# Altium project Main_Board.PrjPcb (part 40 of 44)

## Sheet USB3.SchDoc
size A3; Organization: Altium Limited; Address1: L3, 12a Rodborough Rd; Address2: Frenchs Forest; Address3: NSW; Address4: Australia 2086
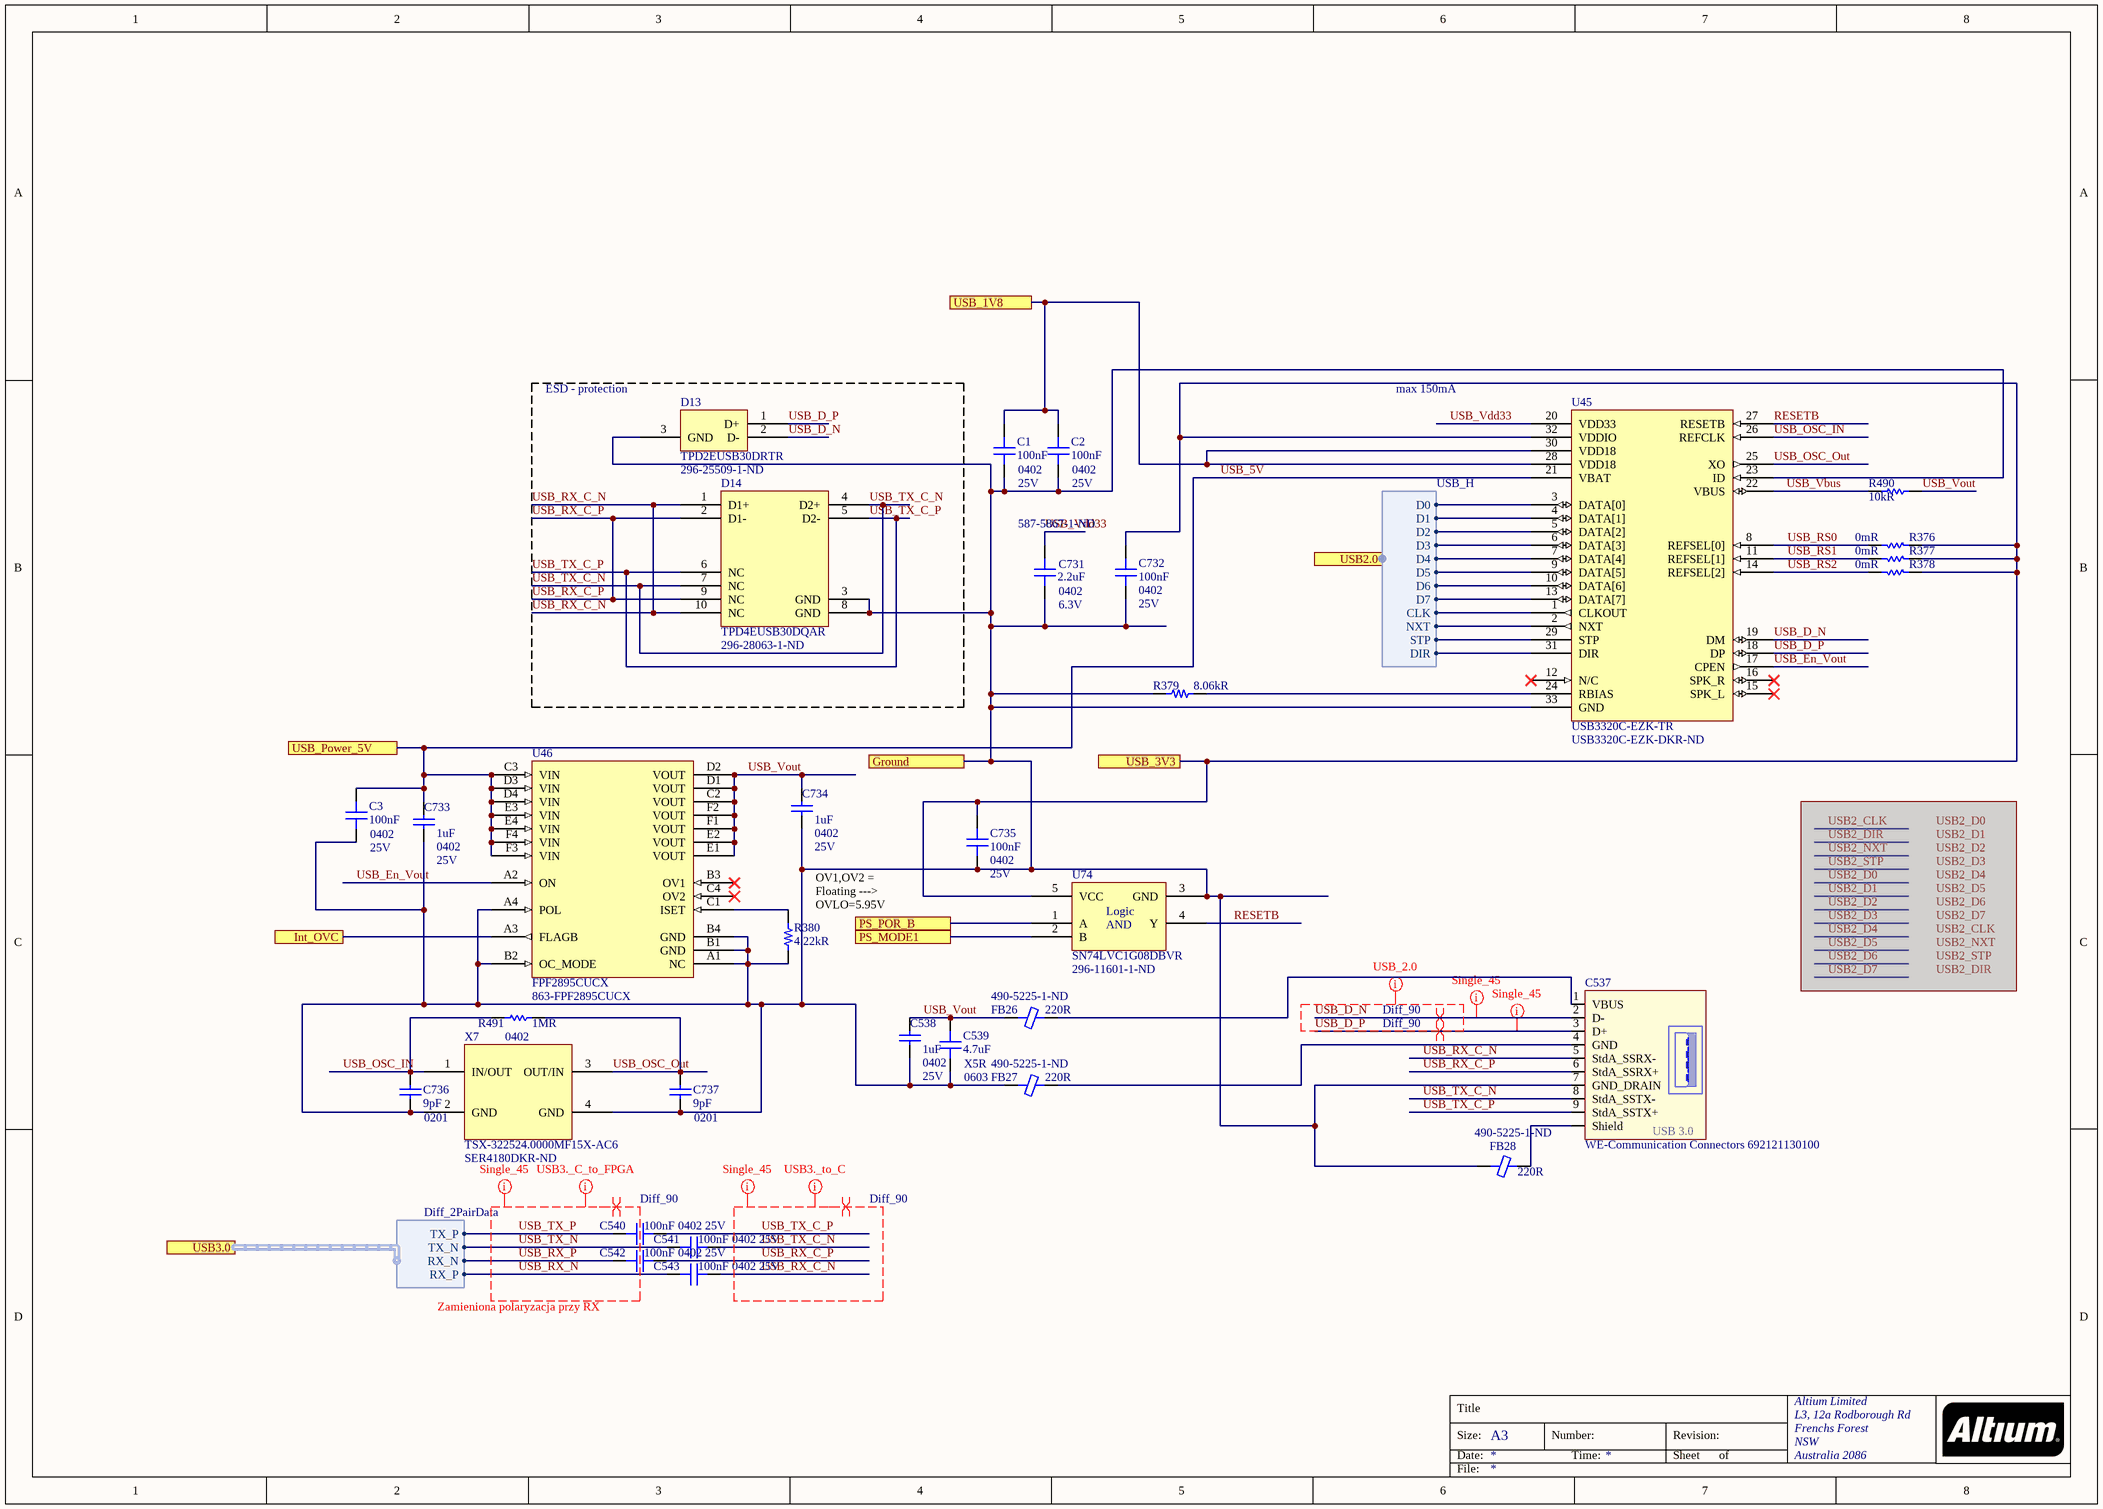
[diagram p64: USB3.SchDoc]

### Parts
C1  100nF  Case/Package: 0402  Voltage Rating: 25V  [CAP 0402/1005 KK]
C2  100nF  Case/Package: 0402  Voltage Rating: 25V  [CAP 0402/1005 KK]
C3  100nF  Case/Package: 0402  Voltage Rating: 25V  [CAP 0402/1005 KK]
C537  WE-Communication Connectors 692121130100  [692121130100]
C538  1uF  Case/Package: 0402  Voltage Rating: 25V  [CAP 0402/1005 KK]
C539  4.7uF  Case/Package: 0603  Dielectric: X5R  [CAP 0603/1608 RF]
C540  100nF  Case/Package: 0402  Voltage Rating: 25V  [CAP 0402/1005 KK]
C541  100nF  Case/Package: 0402  Voltage Rating: 25V  [CAP 0402/1005 KK]
C542  100nF  Case/Package: 0402  Voltage Rating: 25V  [CAP 0402/1005 KK]
C543  100nF  Case/Package: 0402  Voltage Rating: 25V  [CAP 0402/1005 KK]
C731  2.2uF  Supplier Part Number 1: 587-5867-1-ND  Case Code (Imperial): 0402  Voltage Rating: 6.3V  [CAP 0402/1005 KK]
C732  100nF  Case/Package: 0402  Voltage Rating: 25V  [CAP 0402/1005 KK]
C733  1uF  Case/Package: 0402  Voltage Rating: 25V  [CAP 0402/1005 KK]
C734  1uF  Case/Package: 0402  Voltage Rating: 25V  [CAP 0402/1005 KK]
C735  100nF  Case/Package: 0402  Voltage Rating: 25V  [CAP 0402/1005 KK]
C736  9pF  Case/Package: 0201  [CAP 0201/0603 KK]
C737  9pF  Case/Package: 0201  [CAP 0201/0603 KK]
D13  TPD2EUSB30DRTR  Supplier Part Number 1: 296-25509-1-ND  [TPD2EUSB30]
D14  TPD4EUSB30DQAR  Supplier Part Number 1: 296-28063-1-ND  [TPD4EUSB30]
FB26  220R  Supplier Part Number 1: 490-5225-1-ND  [FER 0603/1608]
FB27  220R  Supplier Part Number 1: 490-5225-1-ND  [FER 0603/1608]
FB28  220R  Supplier Part Number 1: 490-5225-1-ND  [FER 0603/1608]
R376  0mR  [RES 0402/1005 RF KK]
R377  0mR  [RES 0402/1005 RF KK]
R378  0mR  [RES 0402/1005 RF KK]
R379  8.06kR  [RES 0402/1005 RF KK]
R380  4.22kR  [RES 0402/1005 RF KK]
R490  10kR  [RES 0402/1005 RF KK]
R491  1MR  Case/Package: 0402  [RES 0402/1005 RF KK]
U45  USB3320C-EZK-TR  Supplier Part Number 1: USB3320C-EZK-DKR-ND  [USB3320]
U46  FPF2895CUCX  Supplier Part Number 1: 863-FPF2895CUCX  [FPF2895C-D]
U74  SN74LVC1G08DBVR  Supplier Part Number 1: 296-11601-1-ND  [SN74LVC1G08DBVR]
X7  TSX-322524.0000MF15X-AC6  Supplier Part Number 1: SER4180DKR-ND  [TSX-3225 24.0000MF15X-AC6]

### Blocks framed on the sheet
ESD - protection: D13 D14

### Ports
Ground, Int_OVC, PS_MODE1, PS_POR_B, USB2.0 (harness USB_H), USB3.0 (harness Diff_2PairData), USB_1V8, USB_3V3, USB_Power_5V

### Harnesses
Diff_2PairData: RX_P, RX_N, TX_P, TX_N
USB_H: CLK, DIR, NXT, STP, D0, D1, D2, D3, D4, D5, D6, D7

### Nets
B503_Ground: C1.1 C2.1 C3.1 C537.7(GND_DRAIN) C538.2 C539.1 C731.1 C732.2 C733.2 C734.2 C735.2 C736.1 C737.1 D13.3(GND) D14.3(GND) D14.8(GND) FB27.1 FB28.1 R379.1 R380.1 U45.23(ID) U45.33(GND) U46.A1(NC) U46.A4(POL) U46.B1(GND) U46.B2(OC_MODE) U46.B4(GND) U74.3(GND) X7.2(GND) X7.4(GND) ; port Ground
1V8@1.5A: C1.2 C2.2 U45.28(VDD18) U45.30(VDD18) ; port USB_1V8
3V3_RAIL: C732.1 C735.1 R376.2 R377.2 R378.2 U45.32(VDDIO) U74.5(VCC) ; port USB_3V3
GPIOa_01.GPIO5: U46.A3(FLAGB) ; port Int_OVC
PS_MODE1: U74.2(B) ; port PS_MODE1
PS_POR: U74.1(A) ; port PS_POR_B
RESETB: U45.27(RESETB) U74.4(Y)
USB2_CLK: U45.1(CLKOUT) ; port USB2.0.CLK
USB2_D0: U45.3(DATA[0]) ; port USB2.0.D0
USB2_D1: U45.4(DATA[1]) ; port USB2.0.D1
USB2_D2: U45.5(DATA[2]) ; port USB2.0.D2
USB2_D3: U45.6(DATA[3]) ; port USB2.0.D3
USB2_D4: U45.7(DATA[4]) ; port USB2.0.D4
USB2_D5: U45.9(DATA[5]) ; port USB2.0.D5
USB2_D6: U45.10(DATA[6]) ; port USB2.0.D6
USB2_D7: U45.13(DATA[7]) ; port USB2.0.D7
USB2_DIR: U45.31(DIR) ; port USB2.0.DIR
USB2_NXT: U45.2(NXT) ; port USB2.0.NXT
USB2_STP: U45.29(STP) ; port USB2.0.STP
USB_5V: C3.2 C733.1 U45.21(VBAT) U46.C3(VIN) U46.D3(VIN) U46.D4(VIN) U46.E3(VIN) U46.E4(VIN) U46.F3(VIN) U46.F4(VIN) ; port USB_Power_5V  [project net 5V_RAIL]
USB_D_N: C537.2(D-) D13.2(D-) U45.19(DM)
USB_D_P: C537.3(D+) D13.1(D+) U45.18(DP)
USB_En_Vout: U45.17(CPEN) U46.A2(ON)
USB_OSC_IN: C736.2 R491.2 U45.26(REFCLK) X7.1(IN/OUT)
USB_OSC_Out: C737.2 R491.1 U45.25(XO) X7.3(OUT/IN)
USB_RS0: R376.1 U45.8(REFSEL[0])
USB_RS1: R377.1 U45.11(REFSEL[1])
USB_RS2: R378.1 U45.14(REFSEL[2])
USB_RX_C_N: C537.5(StdA_SSRX-) C543.1 D14.1(D1+) D14.10(NC)
USB_RX_C_P: C537.6(StdA_SSRX+) C542.1 D14.2(D1-) D14.9(NC)
USB_RX_N: C543.2 ; port USB3.0.RX_P
USB_RX_P: C542.2 ; port USB3.0.RX_N
USB_TX_C_N: C537.8(StdA_SSTX-) C541.1 D14.4(D2+) D14.7(NC)
USB_TX_C_P: C537.9(StdA_SSTX+) C540.1 D14.5(D2-) D14.6(NC)
USB_TX_N: C541.2 ; port USB3.0.TX_N
USB_TX_P: C540.2 ; port USB3.0.TX_P
USB_Vbus: R490.1 U45.22(VBUS)
USB_Vdd33: C731.2 U45.20(VDD33)
USB_Vout: C538.1 C539.2 C734.1 FB26.1 R490.2 U46.C2(VOUT) U46.D1(VOUT) U46.D2(VOUT) U46.E1(VOUT) U46.E2(VOUT) U46.F1(VOUT) U46.F2(VOUT)
NetC537_1: C537.1(VBUS) FB26.2
NetC537_4: C537.4(GND) FB27.2
NetC537_Z1: C537.Z1(Shield) FB28.2
NetR379_2: R379.2 U45.24(RBIAS)
NetR380_2: R380.2 U46.C1(ISET)

Not connected (* = marked no-connect by the designer): U45 12(N/C)* 15(SPK_L)* 16(SPK_R)*; U46 B3(OV1)* C4(OV2)*

### Layout directives
differential pair; differential pair class Diff_90: USB_D_N, USB_D_P, USB_RX_C_N, USB_RX_C_P, USB_RX_N, USB_RX_P, USB_TX_C_N, USB_TX_C_P, USB_TX_N, USB_TX_P
net class Single_45: USB_D_N, USB_D_P, USB_RX_C_N, USB_RX_C_P, USB_RX_N, USB_RX_P, USB_TX_C_N, USB_TX_C_P, USB_TX_N, USB_TX_P
net class USB_2.0: USB_D_N, USB_D_P
net class USB3._to_C: USB_RX_C_N, USB_RX_C_P, USB_TX_C_N, USB_TX_C_P
net class USB3._C_to_FPGA: USB_RX_N, USB_RX_P, USB_TX_N, USB_TX_P

### Notes on the sheet
- max 150mA
- (near R380) OV1,OV2 = Floating ---> OVLO=5.95V
- (near C542) Zamieniona polaryzacja przy RX
- Title
- Size:
- Date:
- A3
- Number:
- Time:
- Revision:
- Sheet
- of
- File:
- (in symbol SN74LVC1G08DBVR) Logic
- (in symbol WE-Communication Connectors 692121130100) USB 3.0

### Library data of the parts
C1-C3 C540-C543 C732 C735 = Capacitor: as C479 on sheet RJ45; Supplier 1: Digi-Key; Supplier Part Number 1: 490-14603-1-ND; Stock 1: 89275; Pricing 1: 1 = 0,10000, 10 = 0,03400, 100 = 0,01520, 500 = 0,01088, 1000 = 0,00855, 2500 = 0,00778, 5000 = 0,00715 (USD); RoHS: Yes; Mount: Surface Mount; Weight: 0.000212oz; Case Code (Imperial): 0402; Case Code (Metric): 1005; Min Operating Temperature: -55°C; Max Operating Temperature: 125°C; Packaging: Tape and Reel; Capacitance: 100nF; Termination: SMD/SMT; Composition: Ceramic; Voltage Rating (DC): 25V; Package Quantity: 50000; Length: 0.039inch; Height: 0.5mm; Width: 0.5mm; Thickness: 0.022inch; ComponentLink1URL: http://www.mouser.com/ds/2/281/c02e-2905.pdf?src-supplier=Mouser; ComponentLink1Description: http://www.mouser.com/ds/2/281/c02e-2905.pdf?src-supplier=Mouser; ComponentLink2URL: http://search.murata.co.jp/Ceramy/image/img/A01X/G101/ENG/GRM155R71E104KE14-01.pdf?src-supplier=Digi-Key; ComponentLink2Description: http://search.murata.co.jp/Ceramy/image/img/A01X/G101/ENG/GRM155R71E104KE14-01.pdf?src-supplier=Digi-Key
C537 = WE-Communication Connectors 692121130100: WR-COM USB 3.0 Horizontal Type A; Manufacturer: Würth Elektronik eiSos GmbH; ComponentLink1 Description: Manufacturer; ComponentLink2 Description: Datasheet; NoPins: 9; ComponentLink1URL: http://www.we-online.de; ComponentLink2URL: http://katalog.we-online.de/em/datasheet/692121130100.pdf; Created by: Karrer Zheng; Created Date: 10/10/2014; partNo: 692121130100
C538 C733 C734 = Capacitor: as C485 on sheet RJ45; Supplier 1: Digi-Key; Supplier Part Number 1: 490-12263-1-ND; Manufacturer: Murata; Manufacturer Part Number: GRT155R61E105KE01D; RoHS: Yes; Category: Ceramic Capacitors; Stock 1: 341453; Pricing 1: 1=0,18000, 10=0,12300, 100=0,06210, 500=0,04248, 1000=0,03758, 2500=0,03594, 5000=0,03268 (USD); Mount: Surface Mount; Case Code (Metric): 1005; Case Code (Imperial): 0402; Min Operating Temperature: -55°C; Max Operating Temperature: 85°C; Packaging: Tape and Reel; Capacitance: 1uF; Tolerance: 10%; Dielectric: X5R; Voltage Rating (DC): 25V; Length: 0.039inch; Width: 0.02inch; Thickness: 0.022inch; Ratings: AEC-Q200; ComponentLink1URL: http://www.farnell.com/datasheets/2165918.pdf?src-supplier=Farnell; ComponentLink1Description: http://www.farnell.com/datasheets/2165918.pdf?src-supplier=Farnell; ComponentLink2URL: http://search.murata.co.jp/Ceramy/image/img/A01X/G101/ENG/GRT155R61E105KE01-01.pdf?src-supplier=Digi-Key; ComponentLink2Description: http://search.murata.co.jp/Ceramy/image/img/A01X/G101/ENG/GRT155R61E105KE01-01.pdf?src-supplier=Digi-Key; ComponentLink3URL: http://www.farnell.com/datasheets/2165918.pdf?src-supplier=Element14; ComponentLink3Description: http://www.farnell.com/datasheets/2165918.pdf?src-supplier=Element14
C539 = Capacitor: as C560 on sheet FTDI; Supplier 1: Digi-Key; Supplier Part Number 1: 1276-1044-1-ND; Stock 1: 2124648; Pricing 1: 1 = 0,13000, 10 = 0,09600, 100 = 0,04520, 500 = 0,03168, 1000 = 0,02622 (USD); RoHS: Yes; Mount: Surface Mount; Case Code (Metric): 1608; Case Code (Imperial): 0603; Contact Plating: Tin; Min Operating Temperature: -55°C; Max Operating Temperature: 85°C; Capacitance: 4.7uF; Package Quantity: 1; Packaging: Tape and Reel; Length: 1.6mm; Height: 0.8mm; Width: 0.031inch; Thickness: 0.035inch; Depth: 0.8mm; Radiation Hardening: No; ComponentLink1URL: https://datasheet.ciiva.com/25797/cl10a475kp8nnnc-25797520.pdf?src-supplier=Digi-Key; ComponentLink1Description: https://datasheet.ciiva.com/25797/cl10a475kp8nnnc-25797520.pdf?src-supplier=Digi-Key; ComponentLink2URL: https://datasheet.ciiva.com/26838/getdatasheetpartid-358676-26838384.pdf?src-supplier=Verical; ComponentLink2Description: https://datasheet.ciiva.com/26838/getdatasheetpartid-358676-26838384.pdf?src-supplier=Verical; ComponentLink3URL: https://datasheet.ciiva.com/16318/cl05b104kq5nnnc-16318245.pdf?src-supplier=Future+Electronics; ComponentLink3Description: https://datasheet.ciiva.com/16318/cl05b104kq5nnnc-16318245.pdf?src-supplier=Future+Electronics
C731 = Capacitor: CAP CER 2.2UF 6.3V X5R 0402; Manufacturer: Taiyo Yuden; Manufacturer Part Number: JMK105BJ225KV-F; Tolerance: 10%; Supplier 1: Digi-Key; RoHS: Yes; Category: Ceramic Capacitors; Stock 1: 4812; Pricing 1: 1=0,10000, 10=0,06000, 100=0,02650, 500=0,01894, 1000=0,01488, 2500=0,01352, 5000=0,01244 (USD); Mount: Surface Mount; Case/Package: 0402; Case Code (Metric): 1005; Min Operating Temperature: -55°C; Max Operating Temperature: 85°C; Packaging: Tape and Reel; Capacitance: 2.2uF; Package Quantity: 10000; Voltage Rating (DC): 6.3V; Dielectric: X5R; Termination: SMD/SMT; Composition: Ceramic; Length: 1mm; Height: 0.5mm; Width: 0.5mm; Thickness: 0.022inch; Depth: 0.5mm; Radiation Hardening: No; ComponentLink1URL: https://datasheet.ciiva.com/15921/tmk105b7103kv-15921011.pdf?src-supplier=Onlinecomponents.com; ComponentLink1Description: https://datasheet.ciiva.com/15921/tmk105b7103kv-15921011.pdf?src-supplier=Onlinecomponents.com; ComponentLink2URL: https://datasheet.ciiva.com/30178/cmultilayerceramiccapacitor-30178599.pdf?src-supplier=Onlinecomponents.com; ComponentLink2Description: https://datasheet.ciiva.com/30178/cmultilayerceramiccapacitor-30178599.pdf?src-supplier=Onlinecomponents.com
C736 C737 = Capacitor: Manufacturer: Murata; Manufacturer Part Number: GRM0335C1E9R0CA01D; Voltage Rating: 25V; Supplier 1: Digi-Key; Supplier Part Number 1: 490-16718-1-ND; Stock 1: 29550; Pricing 1: 1 = 0,10000, 10 = 0,01700, 100 = 0,00740, 500 = 0,00532, 1000 = 0,00417, 2500 = 0,00380, 5000 = 0,00349 (USD); RoHS: Yes; Mount: Surface Mount; Case Code (Metric): 0603; Case Code (Imperial): 0201; Min Operating Temperature: -55°C; Max Operating Temperature: 125°C; Capacitance: 9pF; Packaging: Tape and Reel; Package Quantity: 15000; Termination: SMD/SMT; Voltage Rating (DC): 25V; Length: 0.024inch; Width: 0.012inch; Thickness: 0.013inch; ComponentLink1URL: https://datasheet.ciiva.com/29538/grm0335c1e9r0ca01-01-29538834.pdf?src-supplier=Digi-Key; ComponentLink1Description: https://datasheet.ciiva.com/29538/grm0335c1e9r0ca01-01-29538834.pdf?src-supplier=Digi-Key
D13 = TPD2EUSB30DRTR: as D15 on sheet FTDI; Supplier 1: Digi-Key; Manufacturer Part Number: TPD2EUSB30DRTR; RoHS: Yes; Category: Interface ICs; Stock 1: 293674; Pricing 1: 1=0,58000, 10=0,49400, 25=0,46160, 100=0,34280, 250=0,32564, 500=0,26764, 1000=0,21754 (USD); Case/Package: SOT; Number of Pins: 3; Min Operating Temperature: -40°C; Max Operating Temperature: 85°C; Packaging: Tape and Reel; Package Quantity: 1; Reverse Standoff Voltage: 5.5V; Clamping Voltage: 8V; Breakdown Voltage: 9V; Number of Channels: 2; Working Voltage: 5.5V; ESD Protection: Yes; Length: 1mm; Height: 0.45mm; Depth: 0.8mm; Width: 0.85mm; Radiation Hardening: No; REACH SVHC: No SVHC; Lead Free: Lead Free; ComponentLink1URL: https://datasheet.ciiva.com/1611/tpd2eusb30-1611602.pdf?src-supplier=Newark; ComponentLink1Description: https://datasheet.ciiva.com/1611/tpd2eusb30-1611602.pdf?src-supplier=Newark; ComponentLink2URL: https://datasheet.ciiva.com/15134/getdatasheetpartid-202713-15134479.pdf?src-supplier=Verical; ComponentLink2Description: https://datasheet.ciiva.com/15134/getdatasheetpartid-202713-15134479.pdf?src-supplier=Verical; ComponentLink3URL: https://datasheet.ciiva.com/26787/tpd2eusb30drtr-26787652.pdf?src-supplier=IIIC; ComponentLink3Description: https://datasheet.ciiva.com/26787/tpd2eusb30drtr-26787652.pdf?src-supplier=IIIC; ComponentLink4URL: https://datasheet.ciiva.com/353/tpd2eusb30-353272.pdf?src-supplier=Digi-Key; ComponentLink4Description: https://datasheet.ciiva.com/353/tpd2eusb30-353272.pdf?src-supplier=Digi-Key; ComponentLink5URL: https://datasheet.ciiva.com/1504/1882087-1504248.pdf?src-supplier=Element14; ComponentLink5Description: https://datasheet.ciiva.com/1504/1882087-1504248.pdf?src-supplier=Element14; ComponentLink6URL: https://datasheet.ciiva.com/353/tpd2eusb30-353273.pdf?src-supplier=Digi-Key; ComponentLink6Description: https://datasheet.ciiva.com/353/tpd2eusb30-353273.pdf?src-supplier=Digi-Key; ComponentLink7URL: https://datasheet.ciiva.com/25956/tpd4eusb30-25956841.pdf?src-supplier=Avnet+Europe; ComponentLink7Description: https://datasheet.ciiva.com/25956/tpd4eusb30-25956841.pdf?src-supplier=Avnet+Europe; ComponentLink8URL: https://datasheet.ciiva.com/353/tpd2eusb30-353274.pdf?src-supplier=Digi-Key; ComponentLink8Description: https://datasheet.ciiva.com/353/tpd2eusb30-353274.pdf?src-supplier=Digi-Key
D14 = TPD4EUSB30DQAR: TVS DIODE 5.5V 8V 10SON; Manufacturer: Texas Instruments; Direction: Unidirectional; Capacitance: 0.8pF; Current Rating: 5A; Number of Bidirectional Channels: 4; Peak Pulse Power: 45W; Power Line Protection: Yes; Breakdown Voltage: 7V; Data Rate: 6Gbps; Peak Pulse Current: 1A; Interface: USB; Supplier 1: Digi-Key; Manufacturer Part Number: TPD4EUSB30DQAR; RoHS: Yes; Category: TVS Diodes; Stock 1: 69157; Pricing 1: 1=0,81000, 10=0,71400, 25=0,67040, 100=0,48670, 250=0,46936, 500=0,40664, 1000=0,34608 (USD); Number of Pins: 10; Min Operating Temperature: -40°C; Max Operating Temperature: 85°C; Package Quantity: 1; Packaging: Tape and Reel; Reverse Standoff Voltage: 5.5V; Min Breakdown Voltage: 8V; Clamping Voltage: 8V; Number of Channels: 4; Termination: SMD/SMT; Working Voltage: 5.5V; ESD Protection: Yes; Length: 2.5mm; Height: 0.5mm; Width: 1.1mm; Depth: 1mm; Radiation Hardening: No; REACH SVHC: No SVHC; Lead Free: Lead Free; ComponentLink1URL: https://datasheet.ciiva.com/339/tpd4eusb30-339202.pdf?src-supplier=Digi-Key; ComponentLink1Description: https://datasheet.ciiva.com/339/tpd4eusb30-339202.pdf?src-supplier=Digi-Key; ComponentLink2URL: https://datasheet.ciiva.com/41659/1634000-41659268.pdf?src-supplier=Farnell; ComponentLink2Description: https://datasheet.ciiva.com/41659/1634000-41659268.pdf?src-supplier=Farnell; ComponentLink3URL: https://datasheet.ciiva.com/15134/getdatasheetpartid-299321-15134669.pdf?src-supplier=Verical; ComponentLink3Description: https://datasheet.ciiva.com/15134/getdatasheetpartid-299321-15134669.pdf?src-supplier=Verical; ComponentLink4URL: https://datasheet.ciiva.com/339/tpd4eusb30-339204.pdf?src-supplier=Digi-Key; ComponentLink4Description: https://datasheet.ciiva.com/339/tpd4eusb30-339204.pdf?src-supplier=Digi-Key; ComponentLink5URL: https://datasheet.ciiva.com/1504/1882087-1504249.pdf?src-supplier=Element14; ComponentLink5Description: https://datasheet.ciiva.com/1504/1882087-1504249.pdf?src-supplier=Element14; ComponentLink6URL: https://datasheet.ciiva.com/339/tpd4eusb30-339203.pdf?src-supplier=Digi-Key; ComponentLink6Description: https://datasheet.ciiva.com/339/tpd4eusb30-339203.pdf?src-supplier=Digi-Key; ComponentLink7URL: https://datasheet.ciiva.com/22621/1882087-22621482.pdf?src-supplier=Element14; ComponentLink7Description: https://datasheet.ciiva.com/22621/1882087-22621482.pdf?src-supplier=Element14
FB26-FB28 = Ferrite: as FB29 on sheet uSD; Supplier 1: Digi-Key; RoHS: Yes; Category: Inductors; Stock 1: 123623; Pricing 1: 1=0,14000, 10=0,11600, 25=0,09040, 50=0,07500, 100=0,06460, 250=0,05172, 500=0,04654, 1000=0,03878, 5000=0,03619 (USD); Case/Package: 0603; Number of Pins: 2; Weight: 7.1E-05oz; Core Material: Ferrite; Case Code (Metric): 1608; Case Code (Imperial): 0603; Min Operating Temperature: -55°C; Max Operating Temperature: 125°C; Package Quantity: 1; Impedance: 220R; Packaging: Tape and Reel; Current Rating: 2.5A; Termination: SMD/SMT; Max DC Current: 2.5A; DC Current: 2.5A; Number of Circuits: 1; Length: 1.6mm; Height: 0.8mm; Width: 0.8mm; Depth: 0.95mm; Radiation Hardening: No; REACH SVHC: No SVHC; Lead Free: Lead Free; ComponentLink1URL: https://datasheet.ciiva.com/1561/c31e-1561456.pdf?src-supplier=Newark; ComponentLink1Description: https://datasheet.ciiva.com/1561/c31e-1561456.pdf?src-supplier=Newark; ComponentLink2URL: https://datasheet.ciiva.com/41449/001171724-da-01-en-chip-drossel0603-220r-2500ma-1-6x0-8mm-41449352.pdf?src-supplier=Conrad; ComponentLink2Description: https://datasheet.ciiva.com/41449/001171724-da-01-en-chip-drossel0603-220r-2500ma-1-6x0-8mm-41449352.pdf?src-supplier=Conrad; ComponentLink3URL: https://datasheet.ciiva.com/41449/001172313-da-01-en-drossel-0603-220r-21-6x0-8mm-10000st-41449677.pdf?src-supplier=Conrad; ComponentLink3Description: https://datasheet.ciiva.com/41449/001172313-da-01-en-drossel-0603-220r-21-6x0-8mm-10000st-41449677.pdf?src-supplier=Conrad; ComponentLink4URL: https://datasheet.ciiva.com/1012/l0110s0100blm18s-1012626.pdf?src-supplier=Digi-Key; ComponentLink4Description: https://datasheet.ciiva.com/1012/l0110s0100blm18s-1012626.pdf?src-supplier=Digi-Key; ComponentLink5URL: https://datasheet.ciiva.com/1012/l0110s0100blm18s-1012627.pdf?src-supplier=Digi-Key; ComponentLink5Description: https://datasheet.ciiva.com/1012/l0110s0100blm18s-1012627.pdf?src-supplier=Digi-Key; ComponentLink6URL: https://datasheet.ciiva.com/1012/l0110s0100blm18s-1012628.pdf?src-supplier=Digi-Key; ComponentLink6Description: https://datasheet.ciiva.com/1012/l0110s0100blm18s-1012628.pdf?src-supplier=Digi-Key; ComponentLink7URL: https://datasheet.ciiva.com/17279/l0110s0100blm18s-17279573.pdf?src-supplier=Avnet+Europe; ComponentLink7Description: https://datasheet.ciiva.com/17279/l0110s0100blm18s-17279573.pdf?src-supplier=Avnet+Europe; ComponentLink8URL: https://datasheet.ciiva.com/8508/l0110s0100blm18s-8508310.pdf?src-supplier=Avnet; ComponentLink8Description: https://datasheet.ciiva.com/8508/l0110s0100blm18s-8508310.pdf?src-supplier=Avnet; ComponentLink9URL: https://datasheet.ciiva.com/8021/5151-8021517.pdf?src-supplier=Element14; ComponentLink9Description: https://datasheet.ciiva.com/8021/5151-8021517.pdf?src-supplier=Element14; ComponentLink10URL: https://datasheet.ciiva.com/16204/l0110s0100blm18s-16204029.pdf?src-supplier=Future+Electronics; ComponentLink10Description: https://datasheet.ciiva.com/16204/l0110s0100blm18s-16204029.pdf?src-supplier=Future+Electronics; ComponentLink11URL: https://datasheet.ciiva.com/14122/blm-series-eng-tds-14122910.pdf?src-supplier=Distrelec; ComponentLink11Description: https://datasheet.ciiva.com/14122/blm-series-eng-tds-14122910.pdf?src-supplier=Distrelec; ComponentLink12URL: https://datasheet.ciiva.com/8021/5151-8021519.pdf?src-supplier=Element14; ComponentLink12Description: https://datasheet.ciiva.com/8021/5151-8021519.pdf?src-supplier=Element14
R376-R378 = Resistor: as R711-R713 on sheet RJ45; Supplier 1: Digi-Key; Supplier Part Number 1: 311-0.0JRCT-ND; Stock 1: 69822252; Pricing 1: 1=0.10000, 10=0.01200, 25=0.00920, 50=0.00680, 100=0.00510, 250=0.00388, 500=0.00308, 1000=0.00227, 5000=0.00163 (USD); RoHS: Yes; Case/Package: 0402; Contact Plating: Tin,Matte; Case Code (Metric): 1005; Case Code (Imperial): 0402; Min Operating Temperature: -55°C; Max Operating Temperature: 155°C; Resistance: 0mR; Packaging: Tape and Reel; Composition: Thick Film; Package Quantity: 1; Number of Terminations: 2; Termination: SMD/SMT; Military Standard: Not; Features: Moisture Resistant; Length: 1mm; Height: 0.016inch; Width: 0.02inch; Depth: 0.5mm; Radiation Hardening: No; REACH SVHC: Unknown; Lead Free: Lead Free; ComponentLink1URL: https://datasheet.ciiva.com/2452/pyu-rc0402-51-rohs-l-6-2452608.pdf?src-supplier=Digi-Key; ComponentLink1Description: https://datasheet.ciiva.com/2452/pyu-rc0402-51-rohs-l-6-2452608.pdf?src-supplier=Digi-Key; ComponentLink2URL: https://datasheet.ciiva.com/11808/0900766b80c66297-11808195.pdf?src-supplier=RSComponents; ComponentLink2Description: https://datasheet.ciiva.com/11808/0900766b80c66297-11808195.pdf?src-supplier=RSComponents; ComponentLink3URL: https://datasheet.ciiva.com/2452/pyu-r-int-thick-7-2452609.pdf?src-supplier=Digi-Key; ComponentLink3Description: https://datasheet.ciiva.com/2452/pyu-r-int-thick-7-2452609.pdf?src-supplier=Digi-Key; ComponentLink4URL: https://datasheet.ciiva.com/22747/1018594-22747515.pdf?src-supplier=Element14; ComponentLink4Description: https://datasheet.ciiva.com/22747/1018594-22747515.pdf?src-supplier=Element14; ComponentLink5URL: https://datasheet.ciiva.com/7983/1018594-7983535.pdf?src-supplier=Element14; ComponentLink5Description: https://datasheet.ciiva.com/7983/1018594-7983535.pdf?src-supplier=Element14; ComponentLink6URL: https://datasheet.ciiva.com/2452/pyu-r-int-thick-7-2452610.pdf?src-supplier=Digi-Key; ComponentLink6Description: https://datasheet.ciiva.com/2452/pyu-r-int-thick-7-2452610.pdf?src-supplier=Digi-Key; ComponentLink7URL: https://datasheet.ciiva.com/8896/pyu-rc0402-51-rohs-l-6-8896201.pdf?src-supplier=Avnet; ComponentLink7Description: https://datasheet.ciiva.com/8896/pyu-rc0402-51-rohs-l-6-8896201.pdf?src-supplier=Avnet; ComponentLink8URL: https://datasheet.ciiva.com/28386/pyu-rc0402-51-rohs-l-6-28386633.pdf?src-supplier=Avnet+Europe; ComponentLink8Description: https://datasheet.ciiva.com/28386/pyu-rc0402-51-rohs-l-6-28386633.pdf?src-supplier=Avnet+Europe; ComponentLink9URL: https://datasheet.ciiva.com/15189/getdatasheetpartid-326379-15189533.pdf?src-supplier=Verical; ComponentLink9Description: https://datasheet.ciiva.com/15189/getdatasheetpartid-326379-15189533.pdf?src-supplier=Verical
R379 = Resistor: RES 8.06K OHM 1% 1/16W 0402; Manufacturer: Stackpole Electronics; Manufacturer Part Number: RMCF0402FT8K06; Max Power Dissipation: 63mW; Temperature Coefficient: 100ppm/°C; Supplier 1: Digi-Key; Supplier Part Number 1: RMCF0402FT8K06CT-ND; RoHS: Yes; Category: Chip SMD Resistors; Stock 1: 98746; Pricing 1: 1=0,10000, 10=0,01400, 100=0,00580, 1000=0,00262, 2500=0,00228, 5000=0,00188 (USD); Mount: Surface Mount; Case/Package: 0402; Case Code (Metric): 1005; Case Code (Imperial): 0402; Contact Plating: Tin,Matte; Min Operating Temperature: -55°C; Max Operating Temperature: 155°C; Packaging: Tape and Reel; Resistance: 8.06kR; Tolerance: 1%; Composition: Thick Film; Number of Terminations: 2; Features: Automotive AEC-Q200; Length: 0.039inch; Height: 0.016inch; Width: 0.02inch; Radiation Hardening: No; Lead Free: Lead Free; ComponentLink1URL: https://www.seielect.com/catalog/SEI-RMCF_RMCP.pdf?src-supplier=Avnet; ComponentLink1Description: https://www.seielect.com/catalog/SEI-RMCF_RMCP.pdf?src-supplier=Avnet; ComponentLink2URL: https://www.seielect.com/catalog/SEI-Packaging.pdf?src-supplier=Digi-Key; ComponentLink2Description: https://www.seielect.com/catalog/SEI-Packaging.pdf?src-supplier=Digi-Key; ComponentLink3URL: https://www.seielect.com/Catalog/SEI-RMCF_RMCP.pdf?src-supplier=Digi-Key; ComponentLink3Description: https://www.seielect.com/Catalog/SEI-RMCF_RMCP.pdf?src-supplier=Digi-Key
R380 = Resistor: Thick Film Resistors 4.22K OHM 1%; Manufacturer: Yageo; Manufacturer Part Number: RC0402FR-074K22L; Temperature Coefficient: 100ppm/°C; Power Rating: 62.5mW; Voltage Rating: 50V; Max Power Dissipation: 63mW; Supplier 1: Digi-Key; Supplier Part Number 1: YAG3172CT-ND; RoHS: Yes; Category: Chip SMD Resistors; Stock 1: 1001822; Pricing 1: 1=0,10000, 10=0,01600, 100=0,00640, 1000=0,00289, 2500=0,00251, 5000=0,00207 (USD); Case/Package: 0402; Contact Plating: Tin,Matte; Case Code (Imperial): 0402; Case Code (Metric): 1005; Min Operating Temperature: -55°C; Max Operating Temperature: 155°C; Tolerance: 1%; Resistance: 4.22kR; Composition: Thick Film; Packaging: Tape and Reel; Number of Terminations: 2; Termination: SMD/SMT; Military Standard: Not; Voltage Rating (DC): 50V; Features: Moisture Resistant; Length: 1mm; Height: 0.016inch; Width: 0.02inch; Depth: 0.5mm; Lead Free: Lead Free; ComponentLink1URL: https://datasheet.ciiva.com/26830/getdatasheetpartid-329268-26830134.pdf?src-supplier=Verical; ComponentLink1Description: https://datasheet.ciiva.com/26830/getdatasheetpartid-329268-26830134.pdf?src-supplier=Verical; ComponentLink2URL: https://datasheet.ciiva.com/8893/pyu-rc0402-51-rohs-l-6-8893193.pdf?src-supplier=Avnet; ComponentLink2Description: https://datasheet.ciiva.com/8893/pyu-rc0402-51-rohs-l-6-8893193.pdf?src-supplier=Avnet; ComponentLink3URL: https://datasheet.ciiva.com/28410/pyu-rc0402-51-rohs-l-6-28410877.pdf?src-supplier=Avnet+Europe; ComponentLink3Description: https://datasheet.ciiva.com/28410/pyu-rc0402-51-rohs-l-6-28410877.pdf?src-supplier=Avnet+Europe; ComponentLink4URL: https://datasheet.ciiva.com/5558/pyu-rc0402-51-rohs-l-6-r-5558170.pdf?src-supplier=Mouser; ComponentLink4Description: https://datasheet.ciiva.com/5558/pyu-rc0402-51-rohs-l-6-r-5558170.pdf?src-supplier=Mouser; ComponentLink5URL: https://datasheet.ciiva.com/16857/pyu-rc0402-51-rohs-l-6-16857340.pdf?src-supplier=Avnet+Europe; ComponentLink5Description: https://datasheet.ciiva.com/16857/pyu-rc0402-51-rohs-l-6-16857340.pdf?src-supplier=Avnet+Europe
R490 = Resistor: as R319 on sheet RJ45; Supplier 1: Digi-Key; Supplier Part Number 1: 311-10.0KLRCT-ND; Stock 1: 71214322; Pricing 1: 1=0,10000, 10=0,01500, 100=0,00600, 1000=0,00270, 2500=0,00235, 5000=0,00194 (USD); RoHS: Yes; Case/Package: 0402; Number of Pins: 2; Case Code (Imperial): 0402; Case Code (Metric): 1005; Min Operating Temperature: -55°C; Max Operating Temperature: 155°C; Resistance: 10kR; Packaging: Tape and Reel; Composition: Thick Film; Voltage Rating (DC): 50V; Termination: SMD/SMT; Military Standard: Not; Working Voltage: 50V; Number of Terminations: 2; Length: 1mm; Height: 0.32mm; Width: 0.5mm; Depth: 0.5mm; Lead Pitch: 0.2mm; REACH SVHC: No SVHC; Lead Free: Lead Free; ComponentLink1URL: https://datasheet.ciiva.com/7660/38568-7660787.pdf?src-supplier=Element14; ComponentLink1Description: https://datasheet.ciiva.com/7660/38568-7660787.pdf?src-supplier=Element14; ComponentLink2URL: https://datasheet.ciiva.com/7849/1784430-7849813.pdf?src-supplier=Element14; ComponentLink2Description: https://datasheet.ciiva.com/7849/1784430-7849813.pdf?src-supplier=Element14; ComponentLink3URL: https://datasheet.ciiva.com/7849/1686128-7849814.pdf?src-supplier=Element14; ComponentLink3Description: https://datasheet.ciiva.com/7849/1686128-7849814.pdf?src-supplier=Element14; ComponentLink4URL: https://datasheet.ciiva.com/7849/1784430-7849815.pdf?src-supplier=Element14; ComponentLink4Description: https://datasheet.ciiva.com/7849/1784430-7849815.pdf?src-supplier=Element14; ComponentLink5URL: https://datasheet.ciiva.com/22747/1018594-22747512.pdf?src-supplier=Element14; ComponentLink5Description: https://datasheet.ciiva.com/22747/1018594-22747512.pdf?src-supplier=Element14; ComponentLink6URL: https://datasheet.ciiva.com/12667/pyu-rc0402-51-rohs-l-6-r-12667067.pdf?src-supplier=Mouser; ComponentLink6Description: https://datasheet.ciiva.com/12667/pyu-rc0402-51-rohs-l-6-r-12667067.pdf?src-supplier=Mouser; ComponentLink7URL: https://datasheet.ciiva.com/7983/1018594-7983486.pdf?src-supplier=Element14; ComponentLink7Description: https://datasheet.ciiva.com/7983/1018594-7983486.pdf?src-supplier=Element14
R491 = Resistor: as R335 on sheet RJ45; Supplier 1: Digi-Key; Supplier Part Number 1: 311-1.00MLRDKR-ND; RoHS: Yes; Category: Chip SMD Resistors; Stock 1: 10014745; Pricing 1: 1=0,10000, 10=0,01600, 100=0,00640, 1000=0,00289, 2500=0,00251, 5000=0,00207 (USD); Case Code (Imperial): 0402; Case Code (Metric): 1005; Min Operating Temperature: -55°C; Max Operating Temperature: 155°C; Packaging: Tape and Reel; Resistance: 1MR; Tolerance: 1%; Termination: SMD/SMT; Composition: Thick Film; Military Standard: Not; Length: 1mm; Height: 0.32mm; Depth: 0.5mm; REACH SVHC: Unknown; Lead Free: Lead Free; ComponentLink1URL: https://datasheet.ciiva.com/11808/0900766b80c66297-11808125.pdf?src-supplier=RSComponents; ComponentLink1Description: https://datasheet.ciiva.com/11808/0900766b80c66297-11808125.pdf?src-supplier=RSComponents; ComponentLink2URL: https://datasheet.ciiva.com/7849/1018594-7849883.pdf?src-supplier=Element14; ComponentLink2Description: https://datasheet.ciiva.com/7849/1018594-7849883.pdf?src-supplier=Element14; ComponentLink3URL: https://datasheet.ciiva.com/46394/1018594-46394951.pdf?src-supplier=Element14; ComponentLink3Description: https://datasheet.ciiva.com/46394/1018594-46394951.pdf?src-supplier=Element14; ComponentLink4URL: https://datasheet.ciiva.com/16741/pyu-rc0402-51-rohs-l-6-r-16741081.pdf?src-supplier=Future+Electronics; ComponentLink4Description: https://datasheet.ciiva.com/16741/pyu-rc0402-51-rohs-l-6-r-16741081.pdf?src-supplier=Future+Electronics; ComponentLink5URL: https://datasheet.ciiva.com/7849/1018594-7849882.pdf?src-supplier=Element14; ComponentLink5Description: https://datasheet.ciiva.com/7849/1018594-7849882.pdf?src-supplier=Element14
U45 = USB3320C-EZK-TR: IC TXRX USB 2.0 FLEXPWR 32QFN; Manufacturer 1: Microchip; Data Rate: 12Mbps; Interface: UART; Operating Supply Current: 18uA; ESD Protection: Yes; Number of Transceivers: 1; Operating Supply Voltage: 5.5V; Frequency: 60MHz; Simplex/Duplex: Half Duplex; Receiver Hysteresis: 50mV; Supplier 1: Digi-Key; Manufacturer Part Number 1: USB3320C-EZK-TR; Stock 1: 3750; Pricing 1: 1=1,55000, 25=1,29000 (USD); RoHS: Yes; Case/Package: QFN; Number of Pins: 32; Weight: 0.006653oz; Min Operating Temperature: -40°C; Max Operating Temperature: 85°C; Package Quantity: 4000; Packaging: Tape and Reel; Length: 5.1mm; Height: 0.95mm; Width: 5.1mm; Radiation Hardening: No; Lead Free: Lead Free; ComponentLink1URL: https://datasheet.ciiva.com/29718/3320-29718762.pdf?src-supplier=Digi-Key; ComponentLink1Description: https://datasheet.ciiva.com/29718/3320-29718762.pdf?src-supplier=Digi-Key; ComponentLink2URL: https://datasheet.ciiva.com/6635/filehandler-aspxddocname-en562261-6635128.pdf?src-supplier=Digi-Key; ComponentLink2Description: https://datasheet.ciiva.com/6635/filehandler-aspxddocname-en562261-6635128.pdf?src-supplier=Digi-Key; ComponentLink3URL: https://datasheet.ciiva.com/29718/filehandler-aspxddocname-en562261-29718763.pdf?src-supplier=Digi-Key; ComponentLink3Description: https://datasheet.ciiva.com/29718/filehandler-aspxddocname-en562261-29718763.pdf?src-supplier=Digi-Key
U46 = FPF2895CUCX: Current Limit Load Switch with OVP and TRCB, 28 V, 5 A; Manufacturer 1: ON Semiconductor; Supplier 1: Mouser; Manufacturer Part Number 1: FPF2895CUCX; Stock 1: 808; Pricing 1: 1=2,18000, 10=1,85000, 100=1,48000, 500=1,29000, 1000=1,07000, 3000=1,00000, 6000=0,96500, 9000=0,92800, 24000=0,89200 (USD); RoHS: No
U74 = SN74LVC1G08DBVR: as U76 on sheet RJ45; Supplier 1: Digi-Key; Manufacturer Part Number: SN74LVC1G08DBVR; Stock 1: 64376; Pricing 1: 1 = 0,27000, 10 = 0,22100, 25 = 0,18560, 100 = 0,11740, 250 = 0,09064, 500 = 0,07726, 1000 = 0,05253 (USD); RoHS: Yes; Mount: Surface Mount; Case/Package: SOT-23; Number of Pins: 5; Weight: 0.000557oz; Contact Plating: Gold; Min Operating Temperature: -40°C; Max Operating Temperature: 125°C; Packaging: Tape and Reel; Logic Function: AND; Max Output Current: 32mA; Package Quantity: 1; Number of Circuits: 1; Low Level Output Current: 32mA; Number of Gates: 1; Number of Input Lines: 2; Number of Output Lines: 1; Number of Elements: 1; Termination: SMD/SMT; Number of Bits: 1; Radiation Hardening: No; REACH SVHC: No SVHC; Lead Free: Lead Free; ComponentLink1URL: https://datasheet.ciiva.com/27049/756490-27049780.pdf?src-supplier=Jameco; ComponentLink1Description: https://datasheet.ciiva.com/27049/756490-27049780.pdf?src-supplier=Jameco; ComponentLink2URL: https://datasheet.ciiva.com/26048/sn74lvc1g08-26048421.pdf?src-supplier=Avnet+Europe; ComponentLink2Description: https://datasheet.ciiva.com/26048/sn74lvc1g08-26048421.pdf?src-supplier=Avnet+Europe; ComponentLink3URL: https://datasheet.ciiva.com/16503/sn74lvc1g08-16503398.pdf?src-supplier=Avnet+Asia; ComponentLink3Description: https://datasheet.ciiva.com/16503/sn74lvc1g08-16503398.pdf?src-supplier=Avnet+Asia; ComponentLink4URL: https://datasheet.ciiva.com/46439/1834190-46439158.pdf?src-supplier=Element14; ComponentLink4Description: https://datasheet.ciiva.com/46439/1834190-46439158.pdf?src-supplier=Element14; ComponentLink5URL: https://datasheet.ciiva.com/1864/sn74lvc1g08-1864152.pdf?src-supplier=Digi-Key; ComponentLink5Description: https://datasheet.ciiva.com/1864/sn74lvc1g08-1864152.pdf?src-supplier=Digi-Key; ComponentLink6URL: https://datasheet.ciiva.com/28540/1772545-28540795.pdf?src-supplier=Element14; ComponentLink6Description: https://datasheet.ciiva.com/28540/1772545-28540795.pdf?src-supplier=Element14; ComponentLink7URL: https://datasheet.ciiva.com/1864/sn74lvc1g08-1864153.pdf?src-supplier=Digi-Key; ComponentLink7Description: https://datasheet.ciiva.com/1864/sn74lvc1g08-1864153.pdf?src-supplier=Digi-Key
X7 = TSX-322524.0000MF15X-AC6: CRYSTAL 24.00 MHZ 9.0PF SMD; Manufacturer 1: Epson; Frequency: 24MHz; Load Capacitance: 9pF; ESR (Equivalent Series Resistance): 40R; Frequency Stability: 15ppm; Frequency Tolerance: 10ppm; Supplier 1: Digi-Key; Manufacturer Part Number 1: TSX-322524.0000MF15X-AC6; Stock 1: 33708; Pricing 1: 1=0,36000, 10=0,30300, 50=0,27220, 100=0,24200, 500=0,22990, 1000=0,19360 (USD); RoHS: Yes; Mount: Surface Mount; Case/Package: SMD/SMT; Min Operating Temperature: -40°C; Max Operating Temperature: 85°C; Packaging: Tape and Reel; Length: 0.126inch; Height: 0.024inch; Width: 0.098inch; Lead Free: Lead Free; ComponentLink1URL: https://www5.epsondevice.com/en/information/support/pdf/june_2018_psc_masterbook.pdf?src-supplier=Digi-Key; ComponentLink1Description: https://www5.epsondevice.com/en/information/support/pdf/june_2018_psc_masterbook.pdf?src-supplier=Digi-Key

## Sheet CAN.SchDoc
size A4
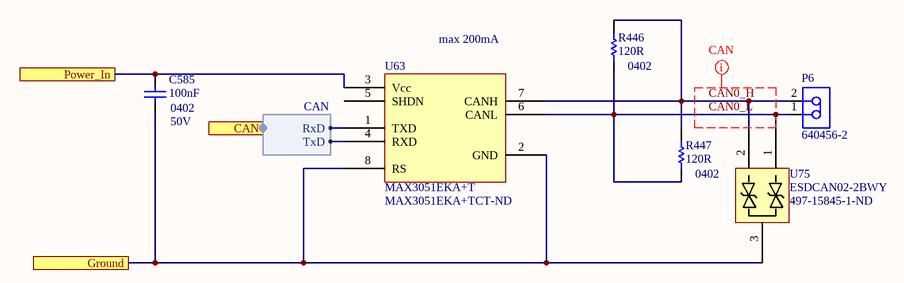
[diagram p65: CAN.SchDoc]

### Parts
C585  100nF  Case Code (Imperial): 0402  Voltage: 50V  [CAP 0402/1005 KK]
P6  640456-2  [TECO-640456-2_V]
R446  120R  Case/Package: 0402  [RES 0402/1005 RF KK]
R447  120R  Case/Package: 0402  [RES 0402/1005 RF KK]
U63  MAX3051EKA+T  Supplier Part Number 1: MAX3051EKA+TCT-ND  [MAX3051EKA+T SOT23]
U75  ESDCAN02-2BWY  Supplier Part Number 1: 497-15845-1-ND  [ESDCAN02-2BWY]

### Ports
CAN (harness CAN), Ground, Power_In

### Harnesses
CAN: RxD, TxD

### Nets
B503_Ground: C585.1 U63.2(GND) U63.8(RS) U75.3 ; port Ground
3V3_RAIL: C585.2 U63.3(Vcc) ; port Power_In
CAN0_H: P6.2 R446.2 R447.2 U63.7(CANH) U75.2
CAN0_L: P6.1 R446.1 R447.1 U63.6(CANL) U75.1
CAN1_RxD: U63.1(TXD) ; port CAN.RxD
CAN1_TxD: U63.4(RXD) ; port CAN.TxD

Not connected (* = marked no-connect by the designer): U63 5(SHDN)

### Layout directives
net class CAN: CAN0_H, CAN0_L

### Notes on the sheet
- (near U63) max 200mA
- Title
- Size:
- Date:
- A3
- Number:
- Time:
- Revision:
- Sheet
- of
- File:

### Library data of the parts
C585 = Capacitor: as C471-C474 on sheet RJ45; Supplier 1: Digi-Key; Supplier Part Number 1: 490-10697-1-ND; RoHS: Yes; Category: Ceramic Capacitors; Stock 1: 435607; Pricing 1: 1=0,10000, 10=0,04600, 100=0,02050, 500=0,01464, 1000=0,01150, 2500=0,01045, 5000=0,00961 (USD); Mount: Surface Mount; Case/Package: 0402; Weight: 0.000212oz; Case Code (Metric): 1005; Min Operating Temperature: -55°C; Max Operating Temperature: 85°C; Capacitance: 100nF; Packaging: Tape and Reel; Voltage Rating: 50V; Dielectric: X5R; Termination: SMD/SMT; Composition: Ceramic; Voltage Rating (DC): 50V; Package Quantity: 10000; Length: 1mm; Height: 0.5mm; Width: 0.02inch; Thickness: 0.022inch; Depth: 0.5mm; REACH SVHC: No SVHC; Lead Free: Lead Free; ComponentLink1URL: http://www.farnell.com/datasheets/2079150.pdf?src-supplier=Farnell; ComponentLink1Description: http://www.farnell.com/datasheets/2079150.pdf?src-supplier=Farnell; ComponentLink2URL: http://www.mouser.com/ds/2/281/c02e-2905.pdf?src-supplier=Mouser; ComponentLink2Description: http://www.mouser.com/ds/2/281/c02e-2905.pdf?src-supplier=Mouser; ComponentLink3URL: http://www.farnell.com/datasheets/2079150.pdf?src-supplier=Element14; ComponentLink3Description: http://www.farnell.com/datasheets/2079150.pdf?src-supplier=Element14; ComponentLink4URL: http://search.murata.co.jp/Ceramy/image/img/A01X/G101/ENG/GRM155R61H104KE14-01.pdf?src-supplier=Digi-Key; ComponentLink4Description: http://search.murata.co.jp/Ceramy/image/img/A01X/G101/ENG/GRM155R61H104KE14-01.pdf?src-supplier=Digi-Key
P6 = 640456-2: Male Header, Pitch 2.54 mm, 1 x 2 Position, Height 10.49 mm, Tail Length 3.556 mm, -55 to 105 degC, RoHS, Bulk; Mounting Hole Size: 0.04 / "; Number of Contacts: 2; Primary Type: Interconnect System; Temperature, Operating: -55 to +105 / °C; Pin Spacing: 0.1 / "; Color, Housing: White; Connector Type: MTA-100; Mount Angle: Vertical; Voltage, Rating: 250 / V; Material, Housing: Polyester; Material, Contact: Copper Alloy; Special Features: Pinstrip; Brand/Series: MTA-100 Series; Contact Centerline Spacing: 0.100 / in.; Contact Termination Area Plating: Tin; Agency Approvals: CSA, UL; Angle: Straight; Standards: RoHS Compliant, ELV Compliant, UL 94V-0; Current, Rating: 5 / A; DatasheetVersion: Rev. W; PackageReference: THD; PackageDescription: HDR, 2-Leads, Body 5.715x5.08mm, Pitch 2.54mm; Supplier 1: Digi-Key; Supplier Part Number 1: A1921-ND; Length, Terminal Post: 0.14 / in.; Contact Mating Area Plating: Tin; Color: White; Length, Pin: 0.14 / "; Termination: Solder; Number of Positions: 2; Length, Overall: 0.2 / "; Contact Shape: Square; Contact Plating: Tin; Mounting Type: PC Mount; Type: PCB Plug; Flammability Rating: UL94V-0; Number of Rows: 1; Size, Post: 0.025 / in.; ComponentLink1Description: Manufacturer URL; ComponentLink1URL: http://www.te.com; ComponentLink2Description: Datasheet; ComponentLink2URL: https://datasheet.ciiva.com/11746/0900766b80eb7fdd-11746365.pdf
R446 R447 = Resistor: RES SMD 120 OHM 1% 1/16W 0402; Manufacturer: Vishay; Manufacturer Part Number: CRCW0402120RFKED; Temperature Coefficient: 100ppm/°C; Power Rating: 63mW; Voltage Rating: 50V; Supplier 1: Digi-Key; Supplier Part Number 1: 541-120LCT-ND; RoHS: Yes; Category: Chip SMD Resistors; Stock 1: 140153; Pricing 1: 1=0,10000, 10=0,03600, 100=0,01460, 1000=0,00657, 2500=0,00570, 5000=0,00471 (USD); Mount: Surface Mount; Weight: 2.3E-05oz; Case Code (Metric): 1005; Case Code (Imperial): 0402; Contact Plating: Tin; Min Operating Temperature: -55°C; Max Operating Temperature: 155°C; Composition: Thick Film; Resistance: 120R; Tolerance: 1%; Packaging: Tape and Reel; Number of Terminations: 2; Termination: SMD/SMT; Military Standard: Not; Package Quantity: 10000; Max Power Dissipation: 63mW; Voltage Rating (DC): 50V; Features: Automotive AEC-Q200; Working Voltage: 50V; Length: 1mm; Height: 0.35mm; Width: 0.02inch; Depth: 0.5mm; Radiation Hardening: No; Lead Free: Lead Free; REACH SVHC: Unknown; ComponentLink1URL: https://datasheet.ciiva.com/11817/0900766b80d98824-11817989.pdf?src-supplier=RSComponents; ComponentLink1Description: https://datasheet.ciiva.com/11817/0900766b80d98824-11817989.pdf?src-supplier=RSComponents; ComponentLink2URL: https://datasheet.ciiva.com/2463/dcrcwe3-2463109.pdf?src-supplier=Digi-Key; ComponentLink2Description: https://datasheet.ciiva.com/2463/dcrcwe3-2463109.pdf?src-supplier=Digi-Key; ComponentLink3URL: https://datasheet.ciiva.com/8336/dcrcwe3-8336661.pdf?src-supplier=Avnet; ComponentLink3Description: https://datasheet.ciiva.com/8336/dcrcwe3-8336661.pdf?src-supplier=Avnet; ComponentLink4URL: https://datasheet.ciiva.com/2463/dcrcwe3-2463110.pdf?src-supplier=Digi-Key; ComponentLink4Description: https://datasheet.ciiva.com/2463/dcrcwe3-2463110.pdf?src-supplier=Digi-Key; ComponentLink5URL: https://datasheet.ciiva.com/5550/dcrcwe3-109170-5550502.pdf?src-supplier=Mouser; ComponentLink5Description: https://datasheet.ciiva.com/5550/dcrcwe3-109170-5550502.pdf?src-supplier=Mouser; ComponentLink6URL: https://datasheet.ciiva.com/2463/dcrcwe3-2463111.pdf?src-supplier=Digi-Key; ComponentLink6Description: https://datasheet.ciiva.com/2463/dcrcwe3-2463111.pdf?src-supplier=Digi-Key; ComponentLink7URL: https://datasheet.ciiva.com/3256/dcrcwe3-3256009.pdf?src-supplier=Avnet; ComponentLink7Description: https://datasheet.ciiva.com/3256/dcrcwe3-3256009.pdf?src-supplier=Avnet; ComponentLink8URL: https://datasheet.ciiva.com/7777/1697337-7777194.pdf?src-supplier=Element14; ComponentLink8Description: https://datasheet.ciiva.com/7777/1697337-7777194.pdf?src-supplier=Element14; ComponentLink9URL: https://datasheet.ciiva.com/7777/1697337-7777195.pdf?src-supplier=Element14; ComponentLink9Description: https://datasheet.ciiva.com/7777/1697337-7777195.pdf?src-supplier=Element14; ComponentLink10URL: https://datasheet.ciiva.com/16881/dcrcwe3-16881548.pdf?src-supplier=Avnet+Europe; ComponentLink10Description: https://datasheet.ciiva.com/16881/dcrcwe3-16881548.pdf?src-supplier=Avnet+Europe; ComponentLink11URL: https://datasheet.ciiva.com/16199/dcrcwe3-16199070.pdf?src-supplier=Future+Electronics; ComponentLink11Description: https://datasheet.ciiva.com/16199/dcrcwe3-16199070.pdf?src-supplier=Future+Electronics; ComponentLink12URL: https://datasheet.ciiva.com/22674/1912744-22674687.pdf?src-supplier=Element14; ComponentLink12Description: https://datasheet.ciiva.com/22674/1912744-22674687.pdf?src-supplier=Element14
U63 = MAX3051EKA+T: IC TXRX CAN 1MBPS SOT23-8; Manufacturer: Maxim; Max Supply Voltage: 3.465V; Min Supply Voltage: 3.135V; Operating Supply Current: 35mA; Number of Transceivers: 1; Max Supply Current: 70mA; Operating Supply Voltage: 3.3V; Supplier 1: Digi-Key; Manufacturer Part Number: MAX3051EKA+T; RoHS: Yes; Category: Interface ICs; Stock 1: 2708; Pricing 1: 1=2,27000, 10=2,04000, 25=1,92800, 100=1,58540, 250=1,58208 (USD); Mount: Surface Mount; Case/Package: SOT-23-8; Number of Pins: 8; Weight: 0.01787oz; Contact Plating: Tin,Matte; Min Operating Temperature: -40°C; Max Operating Temperature: 85°C; Packaging: Tape and Reel; Data Rate: 1Mbps; Package Quantity: 1; Interface: CAN; Number of Transmit Buffers: 1; Number of Receive Buffers: 1; Length: 2.9mm; Height: 1.25mm; Width: 1.625mm; Radiation Hardening: No; REACH SVHC: Unknown; ComponentLink1URL: https://datasheet.ciiva.com/1711/max3051-1711845.pdf?src-supplier=Digi-Key; ComponentLink1Description: https://datasheet.ciiva.com/1711/max3051-1711845.pdf?src-supplier=Digi-Key; ComponentLink2URL: https://datasheet.ciiva.com/1711/max3051-1711846.pdf?src-supplier=Digi-Key; ComponentLink2Description: https://datasheet.ciiva.com/1711/max3051-1711846.pdf?src-supplier=Digi-Key; ComponentLink3URL: https://datasheet.ciiva.com/1711/max3051-1711847.pdf?src-supplier=Digi-Key; ComponentLink3Description: https://datasheet.ciiva.com/1711/max3051-1711847.pdf?src-supplier=Digi-Key; ComponentLink4URL: https://datasheet.ciiva.com/16639/max3051-16639464.pdf?src-supplier=Avnet+Europe; ComponentLink4Description: https://datasheet.ciiva.com/16639/max3051-16639464.pdf?src-supplier=Avnet+Europe; ComponentLink5URL: https://datasheet.ciiva.com/12072/max3051-74908-12072588.pdf?src-supplier=Mouser; ComponentLink5Description: https://datasheet.ciiva.com/12072/max3051-74908-12072588.pdf?src-supplier=Mouser
U75 = ESDCAN02-2BWY: TVS DIODE 26.5VWM 44VC SOT323; Manufacturer: STMicroelectronics; Peak Pulse Current: 3A; Number of Bidirectional Channels: 2; Reverse Standoff Voltage: 26.5V; Min Breakdown Voltage: 28.5V; Clamping Voltage: 44V; Peak Pulse Power: 250W; Power Line Protection: No; Supplier 1: Digi-Key; Manufacturer Part Number: ESDCAN02-2BWY; Stock 1: 3018; Pricing 1: 1 = 0,43000, 10 = 0,32700, 25 = 0,29440, 100 = 0,15530, 250 = 0,15372, 500 = 0,13764, 1000 = 0,10712 (USD); RoHS: Yes; Mount: Surface Mount; Case/Package: SOT-323-3; Min Operating Temperature: -55°C; Max Operating Temperature: 175°C; Composition: Zener; Packaging: Cut Tape; ComponentLink1URL: http://www.mouser.com/ds/2/389/esdcan02-2bwy-954689.pdf?src-supplier=Mouser; ComponentLink1Description: http://www.mouser.com/ds/2/389/esdcan02-2bwy-954689.pdf?src-supplier=Mouser; ComponentLink2URL: https://www.st.com/resource/en/datasheet/esdcan06-2bwy.pdf?src-supplier=Digi-Key; ComponentLink2Description: https://www.st.com/resource/en/datasheet/esdcan06-2bwy.pdf?src-supplier=Digi-Key; ComponentLink3URL: http://www.st.com/content/ccc/resource/sales_and_marketing/promotional_material/selection_guide/fa/8a/bd/fb/a8/06/42/00/sgdiodeauto.pdf/files/sgdiodeauto.pdf/jcr:content/translations/en.sgdiodeauto.pdf?src-supplier=Digi-Key; ComponentLink3Description: http://www.st.com/content/ccc/resource/sales_and_marketing/promotional_material/selection_guide/fa/8a/bd/fb/a8/06/42/00/sgdiodeauto.pdf/files/sgdiodeauto.pdf/jcr:content/translations/en.sgdiodeauto.pdf?src-supplier=Digi-Key